# Altium project Camera-Controller-Board.PrjPcb (part 1 of 18)
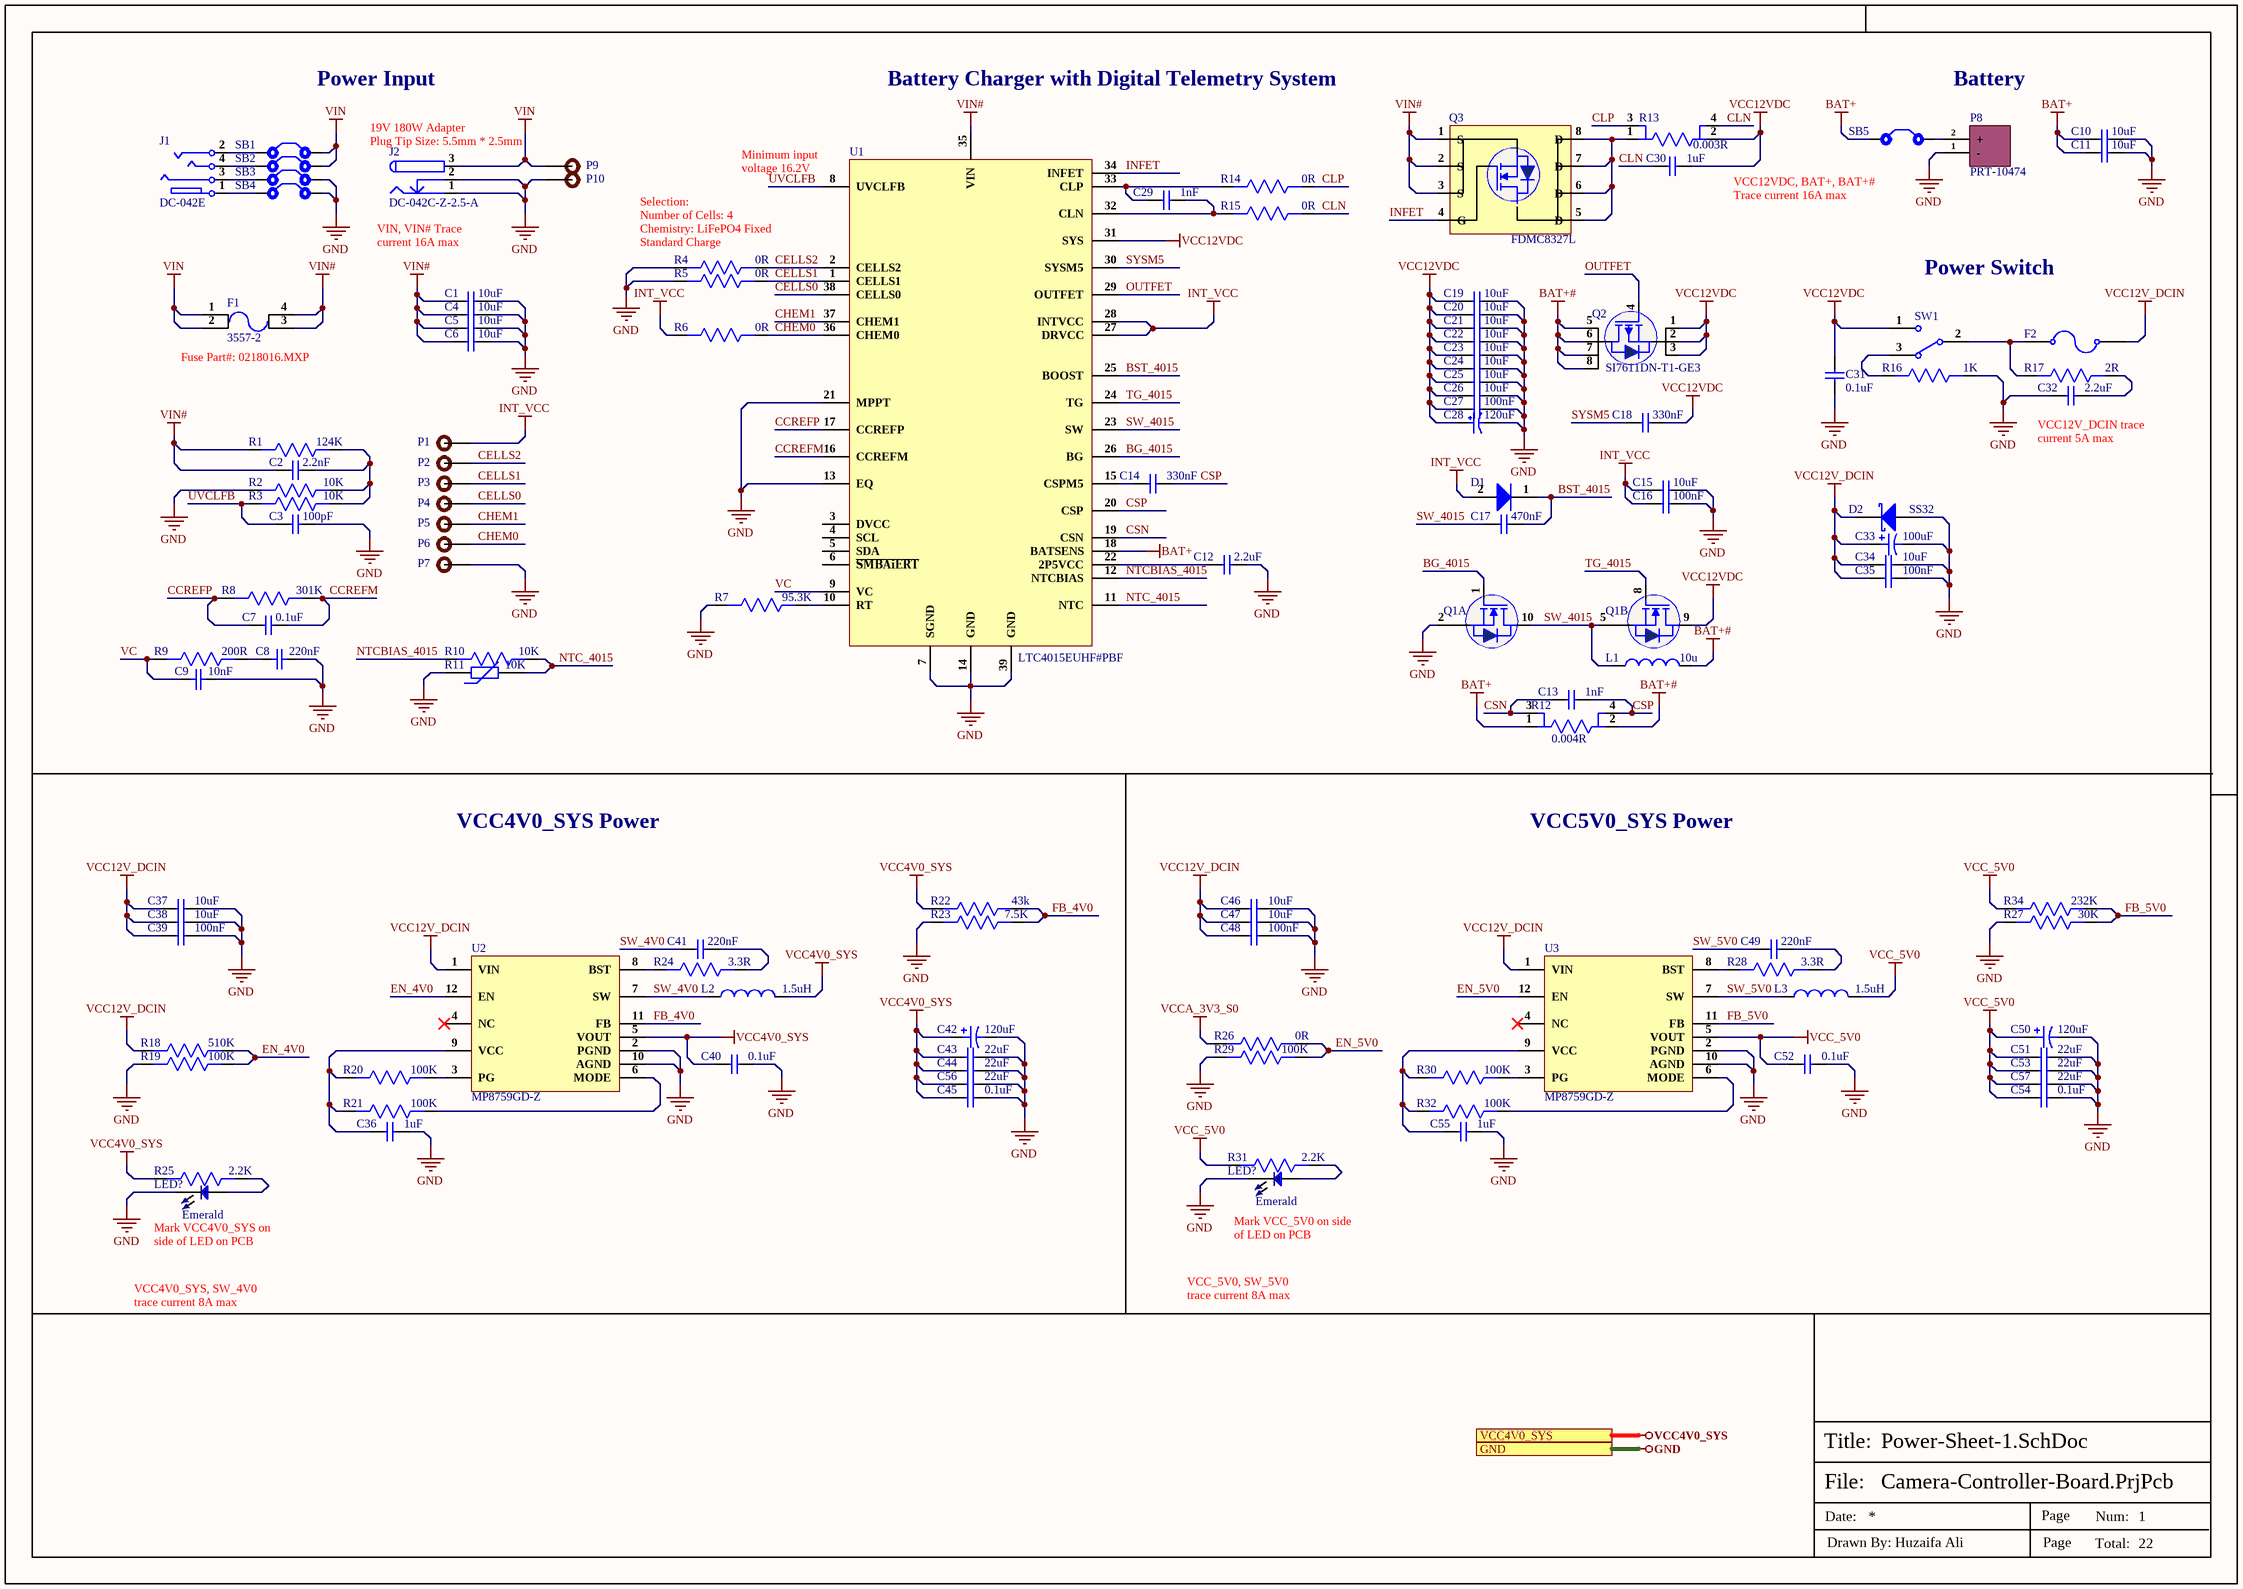
[diagram p0: Power-Sheet-1.SchDoc]
22 sheets, 1081 parts. Net scope: flat (ports and power ports of the same name join across sheets).
Sheets:
  Power-Sheet-1.SchDoc
  Power-Sheet-2.SchDoc
  Power-Sheet-3.SchDoc
  RK3588-Power.SchDoc
  RK3588-OSC-PLL-PMUIO.SchDoc
  RK3588-DDR-Controller.SchDoc
  RK3588-EMMC-SD.SchDoc
  RK3588-USB-Control.SchDoc
  RK3588-SARADC.SchDoc
  RK3588-MIPI-Interface.SchDoc
  RK3588-HDMI.SchDoc
  RK3588-PCIE-SATA.SchDoc
  RK3588-GPIO.SchDoc
  RK3588-USB-Ports.SchDoc
  RK3588-USB_HUB.SchDoc
  RK3588-LPDDR4.SchDoc
  RK3588-EMMC-Flash-TF-Card.SchDoc
  RK3588-HDMI-Connector.SchDoc
  RK3588-eDP-Keys-Debug.SchDoc
  WiFi-Section.SchDoc
  ESP32-Sheet.SchDoc
  CCB-MB-Interface.SchDoc

## Sheet Power-Sheet-1.SchDoc
size 420 x 297 mm; SheetNumber: 1; SheetTotal: 22

### Parts
(Parts that share a designator on the sheet are numbered #1, #2 ... from top to bottom, then left to right.)
C1  10uF  [Cap-1206]
C2  2.2nF  [Cap-0603]
C3  100pF  [Cap-0603]
C4  10uF  [Cap-1206]
C5  10uF  [Cap-1206]
C6  10uF  [Cap-1206]
C7  0.1uF  [Cap-0603]
C8  220nF  [Cap-0402]
C9  10nF  [Cap-0402]
C10  10uF  [Cap-1206]
C11  10uF  [Cap-1206]
C12  2.2uF  [Cap-0402]
C13  1nF  [Cap-0402]
C14  330nF  [Cap-0402]
C15  10uF  [Cap-0603]
C16  100nF  [cap-0402]
C17  470nF  [Cap-0402]
C18  330nF  [Cap-0402]
C19  10uF  [Cap-0603]
C20  10uF  [Cap-0603]
C21  10uF  [Cap-0603]
C22  10uF  [Cap-0603]
C23  10uF  [Cap-0603]
C24  10uF  [Cap-0603]
C25  10uF  [Cap-0603]
C26  10uF  [Cap-0603]
C27  100nF  [cap-0402]
C28  120uF  [40HVH120M]
C29  1nF  [Cap-0402]
C30  1uF  [Cap-0805]
C31  0.1uF  [Cap-0402]
C32  2.2uF  [Cap-0805]
C33  100uF  [Model Name]
C34  10uF  [Cap-1206]
C35  100nF  [Res-0603]
C36  1uF  [Cap-0402]
C37  10uF  [Cap-1206]
C38  10uF  [Cap-1206]
C39  100nF  [Res-0603]
C40  0.1uF  [Cap-0402]
C41  220nF  [Cap-0402]
C42  120uF
C43  22uF  [Cap-0805]
C44  22uF  [Cap-0805]
C45  0.1uF  [Cap-0402]
C46  10uF  [Cap-1206]
C47  10uF  [Cap-1206]
C48  100nF  [Res-0603]
C49  220nF  [Cap-0402]
C50  120uF
C51  22uF  [Cap-0805]
C52  0.1uF  [Cap-0402]
C53  22uF  [Cap-0805]
C54  0.1uF  [Cap-0402]
C55  1uF  [Cap-0402]
C56  22uF  [Cap-0805]
C57  22uF  [Cap-0805]
D1  1N4448HLP-7  [DFN1006-2L_]  (value not drawn)
D2  SS32  [SMC]
F1  3557-2  [3557-2]
F2  JK-SMD200L-24V  [Fuse-2920]  (value not drawn)
J1  DC-042E  [DC-042E]
J2  DC-042C-Z-2.5-A  [DC-042C-Z-2.5-A]
L1  10u  [XAL1010-103ME]
L2  1.5uH  [MHCI06030-1R5M-R8A]
L3  1.5uH  [MHCI06030-1R5M-R8A]
LED?#1  Emerald  [LED-0603]
LED?#2  Emerald  [LED-0603]
P1  TEST POINT  [Test-point]  (value not drawn)
P2  TEST POINT  [Test-point]  (value not drawn)
P3  TEST POINT  [Test-point]  (value not drawn)
P4  TEST POINT  [Test-point]  (value not drawn)
P5  TEST POINT  [Test-point]  (value not drawn)
P6  TEST POINT  [Test-point]  (value not drawn)
P7  TEST POINT  [Test-point]  (value not drawn)
P8  PRT-10474  [PRT-10474]
P9  TEST POINT  [Test-point]  (value not drawn)
P10  TEST POINT  [Test-point]  (value not drawn)
Q1  FDMC8030  [8-Power33 (3x3)]  (value not drawn)  (parts A,B of 2)
Q2  SI7611DN-T1-GE3  [PowerPAK® 1212-8]
Q3  FDMC8327L  [8-MLP (3.3x3.3)]
R1  124K  [Res-0402]
R2  10K  [Res-0402]
R3  10K  [Res-0402]
R4  0R  [Res-0402]
R5  0R  [Res-0402]
R6  0R  [Res-0402]
R7  95.3K  [Res-0402]
R8  301K  [Res-0603]
R9  200R  [Res-0402]
R10  10K  [Res-0402]
R11  10K  [Res-0402]
R12  0.004R  [Wide 1206]
R13  0.003R  [Wide 1206]
R14  0R  [Res-0402]
R15  0R  [Res-0402]
R16  1K  [Res-1206]
R17  2R  [Res_1210]
R18  510K  [Res-0402]
R19  100K  [Res-0402]
R20  100K  [Res-0402]
R21  100K  [Res-0402]
R22  43k  [Res-0402]
R23  7.5K  [Res-0402]
R24  3.3R  [Res-0402]
R25  2.2K  [Res-0402]
R26  0R  [Res-0402]
R27  30K  [Res-0402]
R28  3.3R  [Res-0402]
R29  100K  [Res-0402]
R30  100K  [Res-0402]
R31  2.2K  [Res-0402]
R32  100K  [Res-0402]
R34  232K  [Res-0402]
SB1  Solder Bridge  [Solder Bridge]  (value not drawn)
SB2  Solder Bridge  [Solder Bridge]  (value not drawn)
SB3  Solder Bridge  [Solder Bridge]  (value not drawn)
SB4  Solder Bridge  [Solder Bridge]  (value not drawn)
SB5  Solder Bridge  [Solder Bridge]  (value not drawn)
SW1  SS11-BBIWJ-R30-R  [SS11-BBIWJ-R30-R]  (value not drawn)
U1  LTC4015EUHF#PBF  [38-QFN (5x7)]
U2  MP8759GD-Z  [12-QFN (2x3)_]
U3  MP8759GD-Z  [12-QFN (2x3)_]

### Ports
GND, VCC4V0_SYS

### Nets
BAT+: C10.1 C11.1 R12.1 SB5.1 U1.18(BATSENS)
BAT+#: L1.2 Q2.5(D) Q2.6(D) Q2.7(D) Q2.8(D) R12.2
GND: C1.2 C3.2 C4.2 C5.2 C6.2 C8.1 C9.1 C10.2 C11.2 C12.2 C15.2 C16.2 C19.2 C20.2 C21.2 C22.2 C23.2 C24.2 C25.2 C26.2 C27.2 C28.2 C31.1 C32.1 C33.2 C34.2 C35.2 C36.2 C37.2 C38.2 C39.2 C40.2 C42.2 C43.2 C44.2 C45.2 C46.2 C47.2 C48.2 C50.2 C51.2 C52.2 C53.2 C54.2 C55.2 C56.2 C57.2 D2.2(A) J2.1 J2.2 LED?#1.2 LED?#2.2 P7.1 P8.1(-) P10.1 Q1.2(S1) R2.2 R4.2 R5.2 R7.2 R11.1 R16.1 R19.2 R23.2 R27.2 R29.2 SB3.2 SB4.2 U1.7(SGND) U1.13(EQ) U1.14(GND) U1.21(MPPT) U1.39(GND) U2.2(PGND) U2.10(AGND) U3.2(PGND) U3.10(AGND) ; port GND
INT_VCC: C15.1 C16.1 D1.2(A) P1.1 R6.2 U1.27(DRVCC) U1.28(INTVCC)
VCC4V0_SYS: C40.1 C42.1 C43.1 C44.1 C45.1 C56.1 L2.2 R22.2 R25.2 U2.5(VOUT) ; port VCC4V0_SYS
VCC12V_DCIN: C33.1 C34.1 C35.1 C37.1 C38.1 C39.1 C46.1 C47.1 C48.1 D2.1(K) F2.2 R18.2 U2.1(VIN) U3.1(VIN)
VCC12VDC: C18.2 C19.1 C20.1 C21.1 C22.1 C23.1 C24.1 C25.1 C26.1 C27.1 C28.1 C30.2 C31.2 Q1.9(D2) Q2.1(S) Q2.2(S) Q2.3(S) R13.2 SW1.1 U1.31(SYS)
VCC_5V0: C50.1 C51.1 C52.1 C53.1 C54.1 C57.1 L3.2 R31.2 R34.2 U3.5(VOUT)
VCCA_3V3_S0: R26.2
VIN: F1.1 F1.2 J2.3 P9.1 SB1.2 SB2.2
VIN#: C1.1 C2.1 C4.1 C5.1 C6.1 F1.3 F1.4 Q3.1(S) Q3.2(S) Q3.3(S) R1.2 U1.35(VIN)
BG_4015: Q1.1(G1) U1.26(BG)
BST_4015: C17.2 D1.1(K) U1.25(BOOST)
CCREFM: C7.2 R8.1 U1.16(CCREFM)
CCREFP: C7.1 R8.2 U1.17(CCREFP)
CELLS0: P4.1 U1.38(CELLS0)
CELLS1: P3.1 R5.1 U1.1(CELLS1)
CELLS2: P2.1 R4.1 U1.2(CELLS2)
CHEM0: P6.1 R6.1 U1.36(CHEM0)
CHEM1: P5.1 U1.37(CHEM1)
CLN: C30.1 R13.4 R15.1
CLP: R13.3 R14.1
CSN: C13.1 R12.3 U1.19(CSN)
CSP: C13.2 C14.2 R12.4 U1.20(CSP)
EN_4V0: R18.1 R19.1 U2.12(EN)
EN_5V0: R26.1 R29.1 U3.12(EN)
FB_4V0: R22.1 R23.1 U2.11(FB)
FB_5V0: R27.1 R34.1 U3.11(FB)
INFET: Q3.4(G) U1.34(INFET)
NTC_4015: R10.1 R11.2 U1.11(NTC)
NTCBIAS_4015: R10.2 U1.12(NTCBIAS)
OUTFET: Q2.4(G) U1.29(OUTFET)
SW_4V0: C41.1 L2.1 U2.7(SW)
SW_5V0: C49.1 L3.1 U3.7(SW)
SW_4015: C17.1 L1.1 Q1.5(S2) Q1.10(D1) U1.23(SW)
SYSM5: C18.1 U1.30(SYSM5)
TG_4015: Q1.8(G2) U1.24(TG)
UVCLFB: C3.1 R3.2 U1.8(UVCLFB)
VC: C9.2 R9.2 U1.9(VC)
NetC2_2: C2.2 R1.1 R2.1 R3.1
NetC8_2: C8.2 R9.1
NetC12_1: C12.1 U1.22(2P5VCC)
NetC14_1: C14.1 U1.15(CSPM5)
NetC29_1: C29.1 R15.2 U1.32(CLN)
NetC29_2: C29.2 R14.2 U1.33(CLP)
NetC32_2: C32.2 R17.1
NetC36_1: C36.1 R20.2 R21.2 U2.9(VCC)
NetC41_2: C41.2 R24.1
NetC49_2: C49.2 R28.1
NetC55_1: C55.1 R30.2 R32.2 U3.9(VCC)
NetF2_1: F2.1 R17.2 SW1.2
NetJ1_1: J1.1 SB4.1
NetJ1_2: J1.2 SB1.1
NetJ1_3: J1.3 SB3.1
NetJ1_4: J1.4 SB2.1
NetLED?#1_1: LED?#1.1 R31.1
NetLED?#2_1: LED?#2.1 R25.1
NetP8_2: P8.2(+) SB5.2
NetQ3_5: Q3.5(D) Q3.6(D) Q3.7(D) Q3.8(D) R13.1
NetR7_1: R7.1 U1.10(RT)
NetR16_2: R16.2 SW1.3
NetR20_1: R20.1 U2.3(PG)
NetR21_1: R21.1 U2.6(MODE)
NetR24_2: R24.2 U2.8(BST)
NetR28_2: R28.2 U3.8(BST)
NetR30_1: R30.1 U3.3(PG)
NetR32_1: R32.1 U3.6(MODE)

Not connected (* = marked no-connect by the designer): U1 3(DVCC) 4(SCL) 5(SDA) 6(~{SMBAǐERT}); U2 4(NC)*; U3 4(NC)*

### Notes on the sheet
- Power Input
- Battery Charger with Digital Telemetry System
- Battery
- (near J2) 19V 180W Adapter
  Plug Tip Size: 5.5mm * 2.5mm
- (near U1) Minimum input voltage 16.2V
- (near J2) VIN, VIN# Trace current 16A max
- (near R4) Selection:
  Number of Cells: 4
  Chemistry: LiFePO4 Fixed Standard Charge
- VCC12VDC, BAT+, BAT+# Trace current 16A max
- Power Switch
- (near F1) Fuse Part#: 0218016.MXP
- (near C32) VCC12V_DCIN trace current 5A max
- VCC4V0_SYS Power
- VCC5V0_SYS Power
- Mark VCC4V0_SYS on side of LED on PCB
- Mark VCC_5V0 on side of LED on PCB
- VCC4V0_SYS, SW_4V0 trace current 8A max
- VCC_5V0, SW_5V0 trace current 8A max
- File:
- Title:
- Date:
- Page
- Num:
- Total:
- Drawn By: Huzaifa Ali